# Altium schematic sheet Q_Light_CTRL1.SchDoc
size A3; SheetNumber: 3; SheetTotal: 16
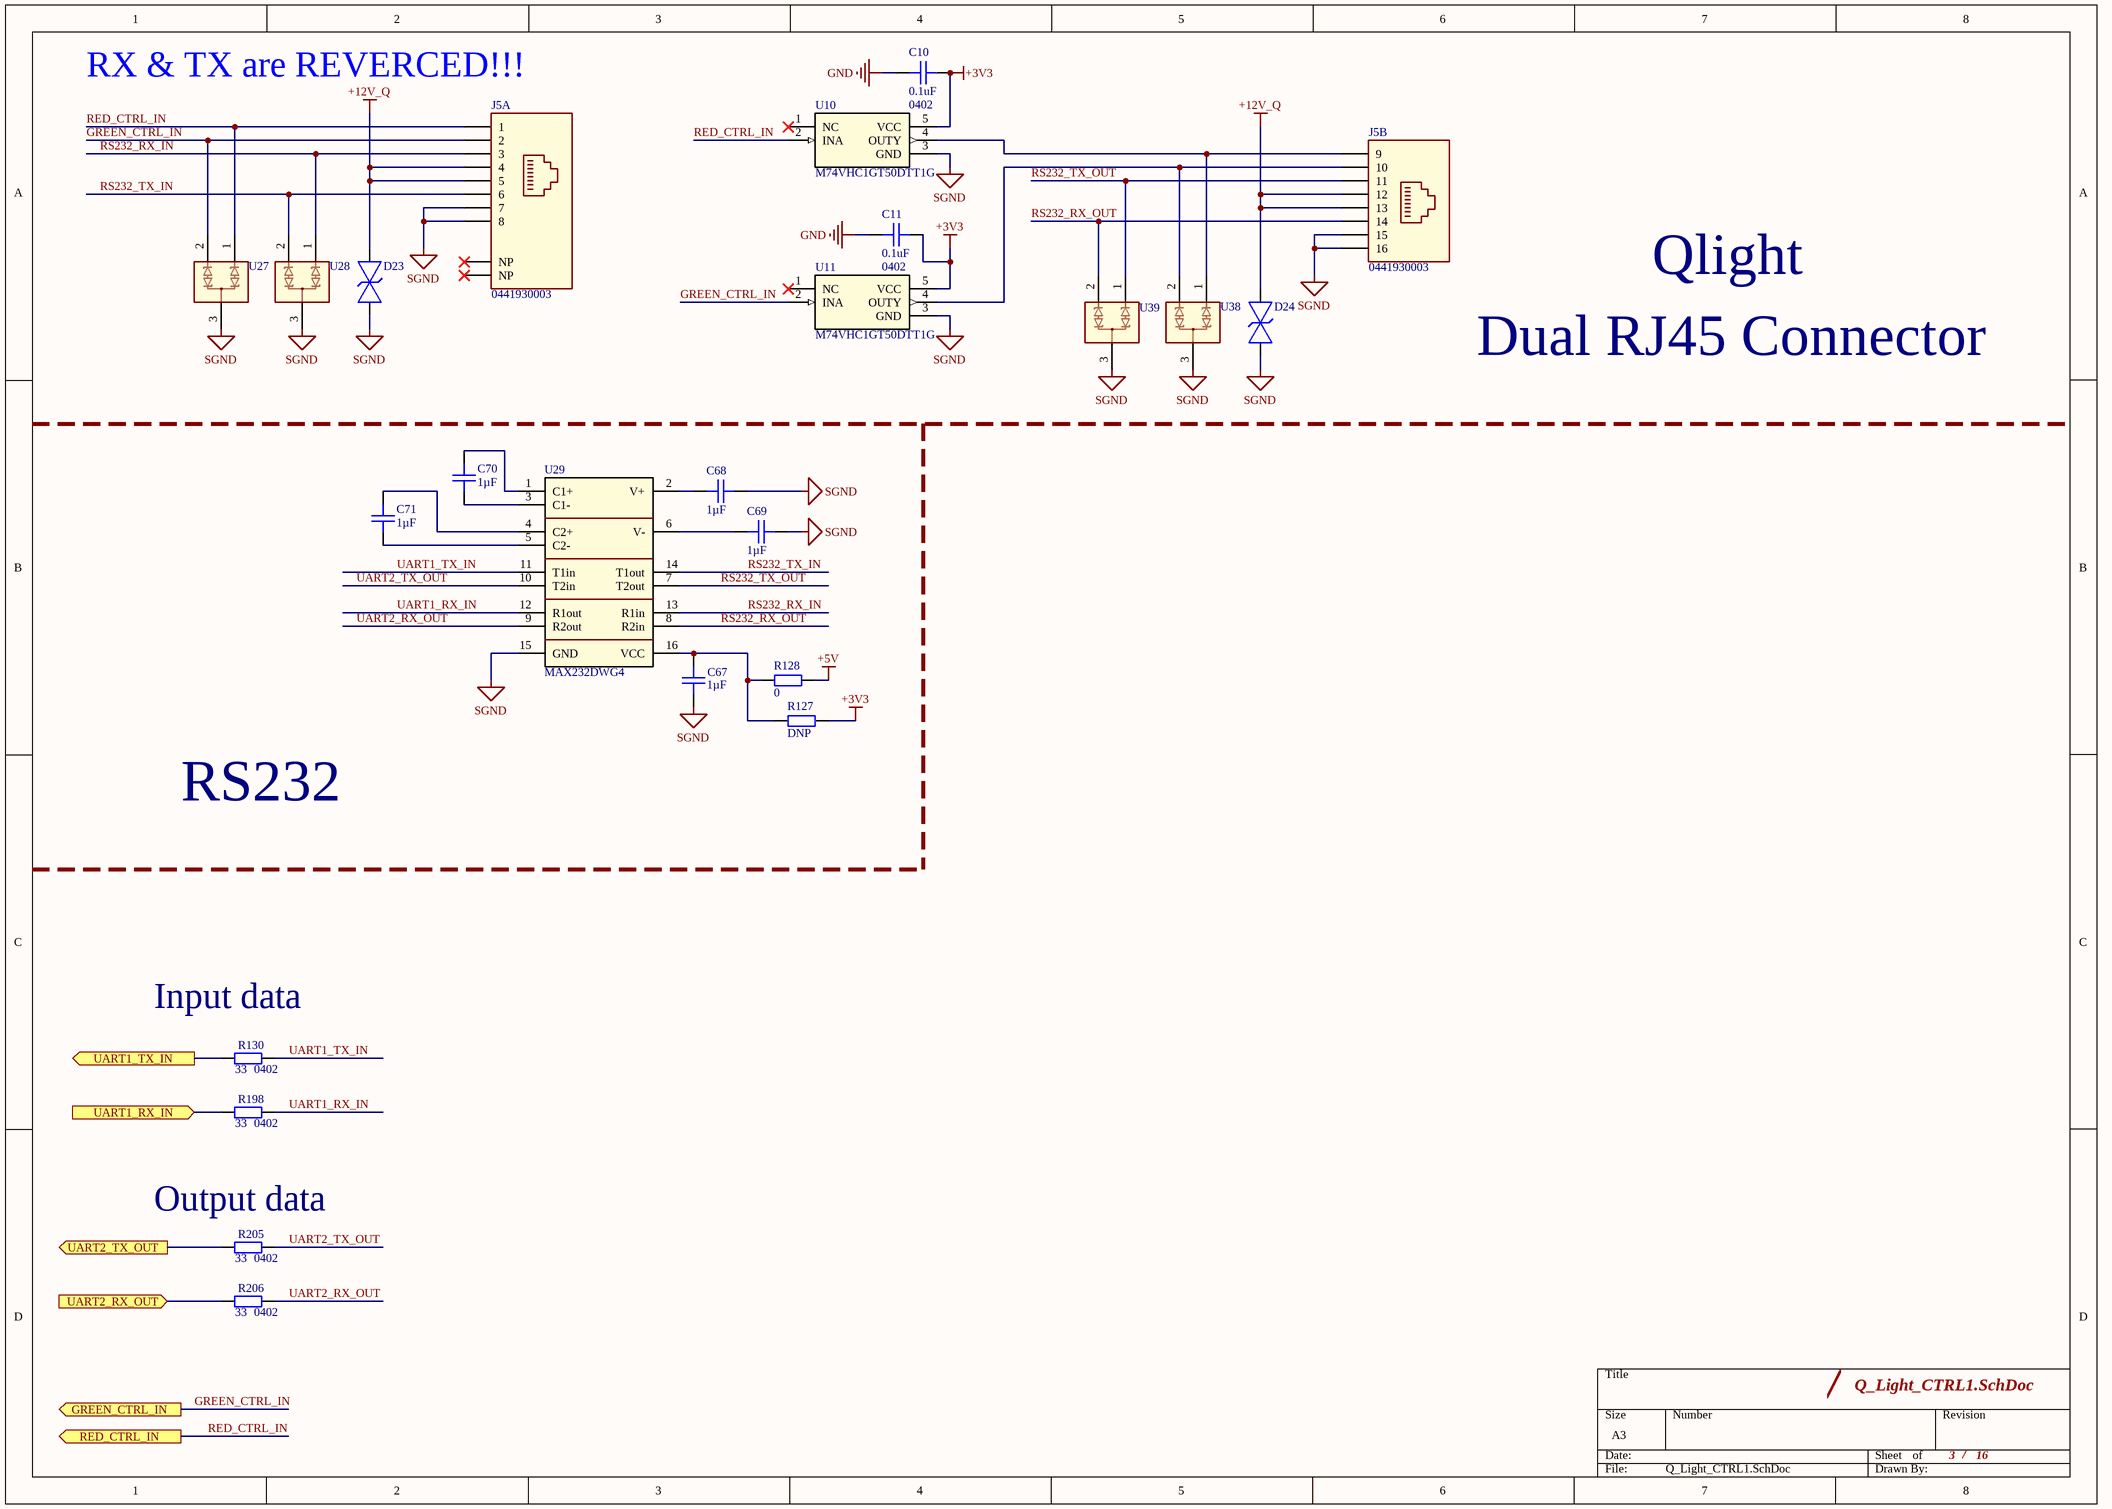
[diagram p0: Q_Light_CTRL1.SchDoc]

## Parts
C10  Capacitance: 0.1uF  Package1: 0402  [CAPC100x50x50L25]  (hidden comment: 04023C104KAT2A)
C11  Capacitance: 0.1uF  Package1: 0402  [CAPC100x50x50L25]  (hidden comment: 04023C104KAT2A)
C67  Capacitance: 1µF  [CAPC100x50x50L25]  (hidden comment: CC0402KPX5R7BB105)
C68  Capacitance: 1µF  [CAPC100x50x50L25]  (hidden comment: CC0402KPX5R7BB105)
C69  Capacitance: 1µF  [CAPC100x50x50L25]  (hidden comment: CC0402KPX5R7BB105)
C70  Capacitance: 1µF  [CAPC100x50x50L25]  (hidden comment: CC0402KPX5R7BB105)
C71  Capacitance: 1µF  [CAPC100x50x50L25]  (hidden comment: CC0402KPX5R7BB105)
D23  82356120100  [DIOM520X260X290XL115X145]  (value not drawn)
D24  82356120100  [DIOM520X260X290XL115X145]  (value not drawn)
J5  0441930003  [0441930003]  (parts A,B of 2)
R127  DNP  [RESC100X50X40L25]
R128  Resistance: 0  [RESC100X50X40L25]  (hidden comment: AC0402JR-070RL)
R130  Resistance: 33  Package2: 0402  [RESC100X50X40L25]  (hidden comment: RC0402FR-0733RL)
R198  Resistance: 33  Package2: 0402  [RESC100X50X40L25]  (hidden comment: RC0402FR-0733RL)
R205  Resistance: 33  Package2: 0402  [RESC100X50X40L25]  (hidden comment: RC0402FR-0733RL)
R206  Resistance: 33  Package2: 0402  [RESC100X50X40L25]  (hidden comment: RC0402FR-0733RL)
U10  M74VHC1GT50DTT1G  [SOP5P95_290X280X145L45X40]
U11  M74VHC1GT50DTT1G  [SOP5P95_290X280X145L45X40]
U27  PESD1CAN,215  [SOT23_PESD1_NEX]  (value not drawn)
U28  PESD1CAN,215  [SOT23_PESD1_NEX]  (value not drawn)
U29  MAX232DWG4  [DW16]
U38  PESD1CAN,215  [SOT23_PESD1_NEX]  (value not drawn)
U39  PESD1CAN,215  [SOT23_PESD1_NEX]  (value not drawn)

## Ports
GREEN_CTRL_IN (out), RED_CTRL_IN (out), UART1_RX_IN (in), UART1_TX_IN (out), UART2_RX_OUT (in), UART2_TX_OUT (out)

## Nets
+3V3: C10.1 C11.1 R127.2 U10.5(VCC) U11.5(VCC)
+5V: R128.2
+12V_Q: D23.1 D24.1 J5.4 J5.5 J5.12 J5.13
GND: C10.2 C11.2
SGND: C67.2 C68.1 C69.1 D23.2 D24.2 J5.7 J5.8 J5.15 J5.16 U10.3(GND) U11.3(GND) U27.3 U28.3 U29.15(GND) U38.3 U39.3
GREEN_CTRL_IN: J5.2 U11.2(INA) U27.2 ; port GREEN_CTRL_IN
RED_CTRL_IN: J5.1 U10.2(INA) U27.1 ; port RED_CTRL_IN
RS232_RX_IN: J5.3 U28.1 U29.13(R1in)
RS232_RX_OUT: J5.14 U29.8(R2in) U39.2
RS232_TX_IN: J5.6 U28.2 U29.14(T1out)
RS232_TX_OUT: J5.11 U29.7(T2out) U39.1
UART1_RX_IN: R198.1 U29.12(R1out)
UART1_RX_IN: R198.2 ; port UART1_RX_IN  [a separate net that carries the same name]
UART1_TX_IN: R130.1 U29.11(T1in)
UART1_TX_IN: R130.2 ; port UART1_TX_IN  [a separate net that carries the same name]
UART2_RX_OUT: R206.1 U29.9(R2out)
UART2_RX_OUT: R206.2 ; port UART2_RX_OUT  [a separate net that carries the same name]
UART2_TX_OUT: R205.1 U29.10(T2in)
UART2_TX_OUT: R205.2 ; port UART2_TX_OUT  [a separate net that carries the same name]
NetC67_1: C67.1 R127.1 R128.1 U29.16(VCC)
NetC68_2: C68.2 U29.2(V+)
NetC69_2: C69.2 U29.6(V-)
NetC70_1: C70.1 U29.1(C1+)
NetC70_2: C70.2 U29.3(C1-)
NetC71_1: C71.1 U29.4(C2+)
NetC71_2: C71.2 U29.5(C2-)
NetJ5_9: J5.9 U10.4(OUTY) U38.1
NetJ5_10: J5.10 U11.4(OUTY) U38.2

Not connected (* = marked no-connect by the designer): J5 17(NP)* 18(NP)*; U10 1(NC)*; U11 1(NC)*

## Notes on the sheet
- (near J5) RX & TX are REVERCED!!!
- Qlight
- Dual RJ45 Connector
- RS232
- (near R130) Input data
- (near R205) Output data
- /

## Library data of the parts
C10 C11 = CMP-001-0374-4: 0402 25V X7R 100 NF 10%; Manufacturer: KYOCERA AVX; Op Temp max: 85°C; Op Temp min: -55°C; ComponentLink3URL: https://www.digikey.com/en/products/detail/yageo/CC0402MRX5R5BB106/5195138; MPN: 04023C104KAT2A; ComponentLink1URL: https://www.yageo.com/upload/media/product/productsearch/datasheet/mlcc/UPY-GPHC_X5R_4V-to-50V_26.pdf; Package: 0402 (1005 Metric); Size: 1.00mm x 0.50mm; Height max: 700µm; Mounting Type: SM; Tolerance: 10%; ComponentLink1Description: Datasheet; ComponentLink3Description: Digikey; Ratings: -; Dielectric: X7R; ComponentLink2Description: Mouser; ComponentLink2URL: https://eu.mouser.com/ProductDetail/YAGEO/CC0402MRX5R5BB106?qs=zEY9bCHj09eCmUJdZuS5Lg%3D%3D; Lead Spacing: 0mm; Component Type: Ceramic Capacitor; Voltage Rating: 25V
C67-C71 = CMP-001-0374-4: CAP CER 1UF 16V X5R 0402; Manufacturer: YAGEO; Op Temp max: 85°C; Op Temp min: -55°C; Tolerance: 10%; MPN: CC0402KPX5R7BB105; ComponentLink1URL: https://www.yageo.com/upload/media/product/productsearch/datasheet/mlcc/UPY-GPHC_X5R_4V-to-50V_26.pdf; Package: 0402 (1005 Metric); Size: 1.00mm x 0.50mm; Height max: 700µm; Mounting Type: SM; ComponentLink1Description: Datasheet; Ratings: -; Dielectric: X5R; ComponentLink2Description: Mouser; Lead Spacing: 0mm; Component Type: Ceramic Capacitor; Voltage Rating: 16V
  C67-C69 C71: ComponentLink3URL: https://www.digikey.com/en/products/detail/yageo/CC0402MRX5R5BB106/5195138; ComponentLink3Description: Digikey; ComponentLink2URL: https://eu.mouser.com/ProductDetail/YAGEO/CC0402MRX5R5BB106?qs=zEY9bCHj09eCmUJdZuS5Lg%3D%3D
  C70: ComponentLink2URL: https://eu.mouser.com/ProductDetail/YAGEO/CC0402KPX5R7BB105?qs=W0yvOO0ixfFHgNkeru%2FKgA%3D%3D
D23 D24 = ESD_Diode 0603: TVS DEVICE 60V 0603; Manufacturer: Würth Elektronik; Working Voltage: 12 V; Capacitance: 10pF; Op Temp min: -45°C; Op Temp max: +85°C; Mounting Type: SM; ComponentLink3Description: Digikey; ComponentLink1Description: Datasheet; Diode Type: TVS; Voltage - DC max: 60V; ComponentLink1URL: https://www.we-online.com/components/products/datasheet/82356120100.pdf; Package: 0603; Height max: 0.9mm; ComponentLink3URL: https://www.digikey.com/en/products/detail/w%C3%BCrth-elektronik/82356120100/9817490; Size: 1.6mm x 0.8mm; MPN: 82356120100
J5 = 0441930003: CONN MOD JACK 8P8C R/A UNSHLD; MNF: Molex; Connector type: Jack (RJ45,Ethernet); Series: 44193; Mounting type: Surface Mount; Datasheet: https://www.molex.com/content/dam/molex/molex-dot-com/products/automated/en-us/salesdrawingpdf/441/44193/441930003_sd.pdf?inline; DigiKey: https://www.digikey.at/en/products/detail/molex/0441930003/2405005; MPN: 0441930003
R127 = CMP-001-0484-6: RES SMD 0 OHM JUMPER 1/16W 0402; Manufacturer: YAGEO; Power: 63mW; Op Temp min: -55°C; Temperature Coefficient: ±100ppm; Resistance: 0; Op Temp max: 155°C; ComponentLink3URL: https://www.digikey.com/en/products/detail/yageo/RC0402FR-0727RL/5280946; ComponentLink2Description: Mouser; Ratings: -; Tolerance: Jumper; Height max: 400µm; MPN: DNP; ComponentLink1URL: https://www.yageo.com/upload/media/product/productsearch/datasheet/rchip/PYu-RC_Group_51_RoHS_L_12.pdf; Size: 1.00mm x 0.50mm; Composition: Thick Film; Package: 0402 (1005 Metric); ComponentLink3Description: Digikey; Mounting Type: SM; ComponentLink2URL: https://eu.mouser.com/ProductDetail/YAGEO/RC0402FR-0727RL?qs=UOUeRUa%252B8Wlb37UyFHw9Bw%3D%3D; ComponentLink1Description: Datasheet; Component Type: Chip Resistor
R128 = CMP-001-0484-6: RES SMD 0 OHM JUMPER 1/16W 0402; Manufacturer: YAGEO; Power: 63mW; Op Temp min: -55°C; Temperature Coefficient: ±100ppm; Op Temp max: 155°C; ComponentLink3URL: https://www.digikey.com/en/products/detail/yageo/RC0402FR-0727RL/5280946; ComponentLink2Description: Mouser; Ratings: -; Tolerance: Jumper; Height max: 400µm; MPN: AC0402JR-070RL; ComponentLink1URL: https://www.yageo.com/upload/media/product/productsearch/datasheet/rchip/PYu-RC_Group_51_RoHS_L_12.pdf; Size: 1.00mm x 0.50mm; Composition: Thick Film; Package: 0402 (1005 Metric); ComponentLink3Description: Digikey; Mounting Type: SM; ComponentLink2URL: https://eu.mouser.com/ProductDetail/YAGEO/RC0402FR-0727RL?qs=UOUeRUa%252B8Wlb37UyFHw9Bw%3D%3D; ComponentLink1Description: Datasheet; Component Type: Chip Resistor
R130 R198 R205 R206 = CMP-001-0484-6: RES 33 OHM 1% 1/16W 0402; Manufacturer: YAGEO; Power: 63mW; Op Temp min: -55°C; Temperature Coefficient: ±100ppm; Op Temp max: 155°C; ComponentLink3URL: https://www.digikey.com/en/products/detail/yageo/RC0402FR-0727RL/5280946; ComponentLink2Description: Mouser; Ratings: -; Tolerance: 1%; Height max: 400µm; MPN: RC0402FR-0733RL; ComponentLink1URL: https://www.yageo.com/upload/media/product/productsearch/datasheet/rchip/PYu-RC_Group_51_RoHS_L_12.pdf; Size: 1.00mm x 0.50mm; Composition: Thick Film; Package: 0402 (1005 Metric); ComponentLink3Description: Digikey; Mounting Type: SM; ComponentLink2URL: https://eu.mouser.com/ProductDetail/YAGEO/RC0402FR-0727RL?qs=UOUeRUa%252B8Wlb37UyFHw9Bw%3D%3D; ComponentLink1Description: Datasheet; Component Type: Chip Resistor
U10 U11 = M74VHC1GT50DTT1G: IC BUFFER NON-INVERT 5.5V 5TSOP; Logic Type: Buffer, Non-Inverting; Manufacturer_Part_Number: M74VHC1GT50DTT1G; MPN: M74VHC1GT50DTT1G
U27 U28 U38 U39 = PESD1CAN,215: TVS DIODE 24VWM 70VC TO236AB; Mfr_Name: Nexperia; Voltage - Reverse Standoff (Typ): 24V; Current - Peak Pulse (10/1000µs): 3A (8/20µs); MPN: PESD1CAN,215; Type: DEV; ComponentLink1Description: DigiKey; ComponentLink1URL: https://www.digikey.at/en/products/detail/nexperia-usa-inc/pesd1can-215/1157428; ComponentLink2Description: Datasheet; ComponentLink2URL: https://assets.nexperia.com/documents/data-sheet/PESD1CAN.pdf
U29 = MAX232DWG4: IC TRANSCEIVER FULL 2/2 16SOIC; Mfr_Name: Texas Instruments; Copyright: Copyright (C) 2024 Ultra Librarian. All rights reserved.; MPN: MAX232DWG4; RefDes: RefDes; Type: DEV